# Altium schematic sheet CPU_PWR - +VCCCORE_1_3.schdoc
size 420 x 298 mm; Symbol: Sheet-Symbol_A3; Company: 嘉立创EDA; Version: V1.0; Page Size: A3; @Project Name: H610(2024/12/09); @Page Count: 36; @Update Date: 2026-10-20; @Create Date: 2026-10-20; @Schematic Name: SCHEMATIC1; @Page No: 27; @Page Name: CPU_PWR - +VCCCORE_1/3; Device: Sheet-Symbol_A3; @Board Name: SCHEMATIC1; @Create Time: 10:15:42; @Update Time: 10:18:20
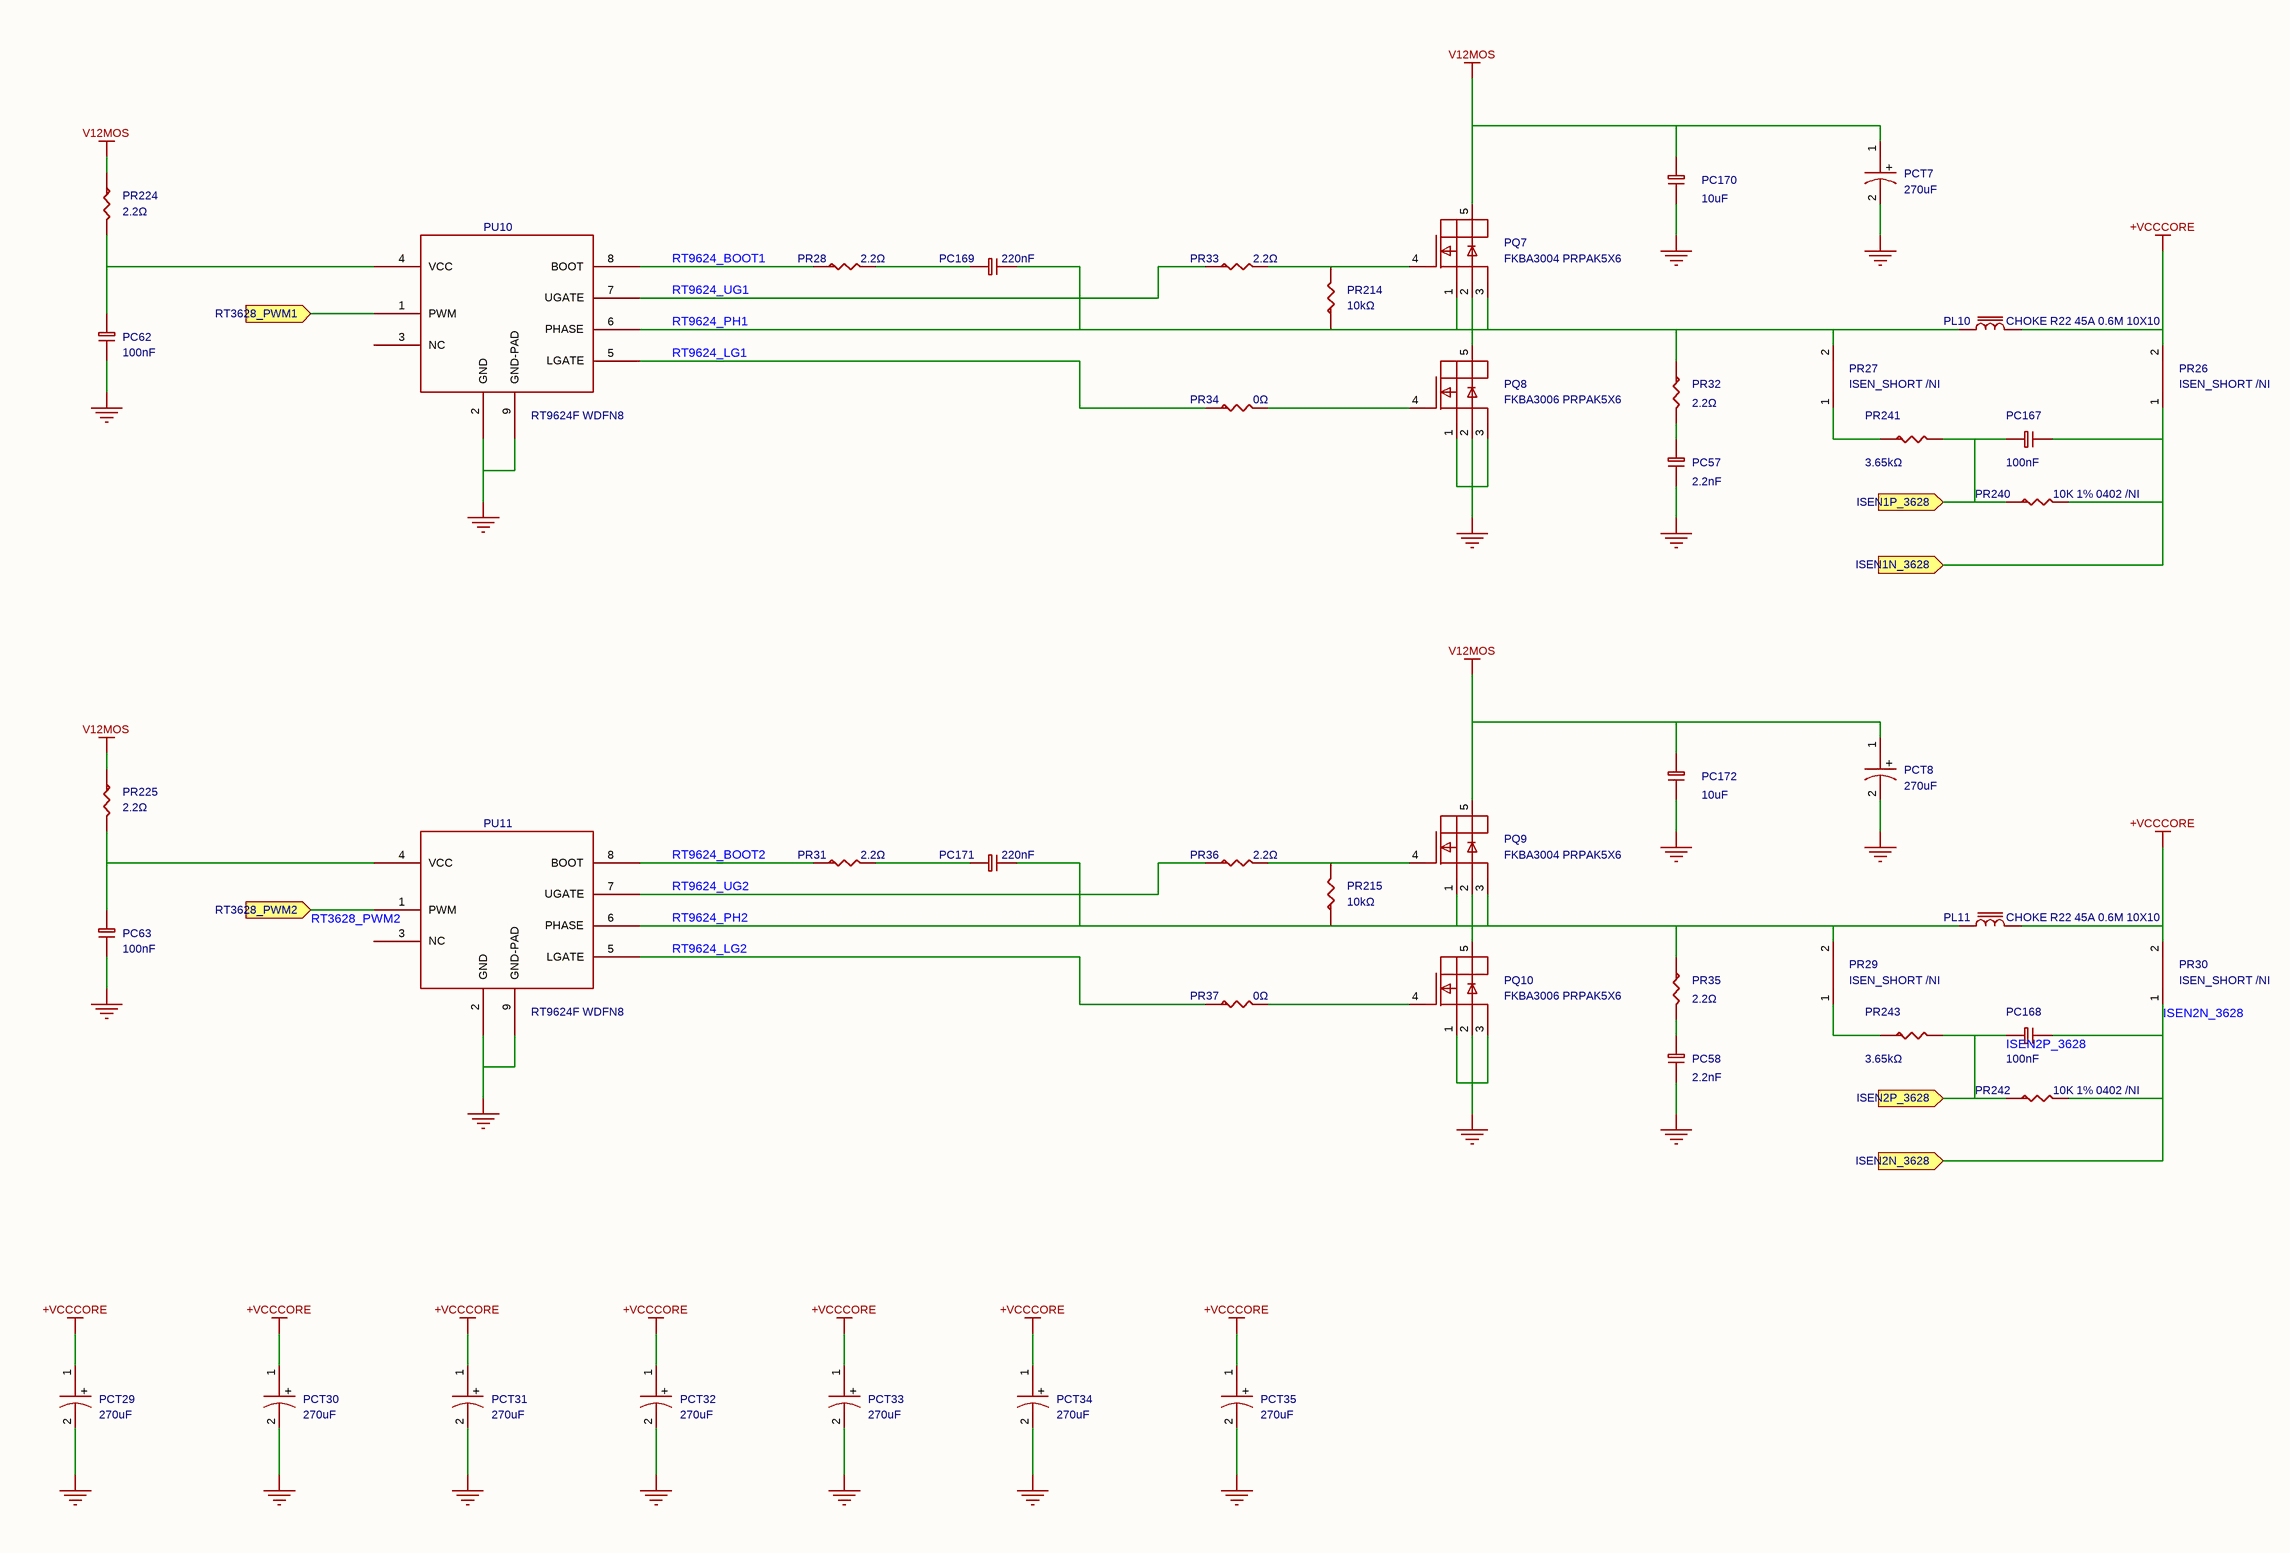
[diagram p0: CPU_PWR - +VCCCORE_1_3.schdoc]

## Parts
PC57  2.2nF  [C0402_2]
PC58  2.2nF  [C0402_2]
PC62  100nF  [C0402]
PC63  100nF  [C0402]
PC167  100nF  [C0402_3]
PC168  100nF  [C0402_3]
PC169  220nF  [C0402_3]
PC170  10uF  [C0805]
PC171  220nF  [C0402_3]
PC172  10uF  [C0805]
PCT7  270uF  [EC1P25C_2]
PCT8  270uF  [EC1P25C_2]
PCT29  270uF  [EC1P25C_2]
PCT30  270uF  [EC1P25C_2]
PCT31  270uF  [EC1P25C_2]
PCT32  270uF  [EC1P25C_2]
PCT33  270uF  [EC1P25C_2]
PCT34  270uF  [EC1P25C_2]
PCT35  270uF  [EC1P25C_2]
PL10  value CHOKE R22 45A 0.6M 10X10  [MAGIC R22]  (hidden comment: L_L70-P50-H70)
PL11  value CHOKE R22 45A 0.6M 10X10  [MAGIC R22]  (hidden comment: L_L70-P50-H70)
PQ7  value FKBA3004 PRPAK5X6  [PRPAK5X6_1]  (hidden comment: PK616BA)
PQ8  value FKBA3006 PRPAK5X6  [PRPAK5X6]  (hidden comment: PK616BA)
PQ9  value FKBA3004 PRPAK5X6  [PRPAK5X6_1]  (hidden comment: PK616BA)
PQ10  value FKBA3006 PRPAK5X6  [PRPAK5X6]  (hidden comment: PK616BA)
PR26  value ISEN_SHORT /NI  [ISEN_SHORTNI]  (hidden comment: R_0)
PR27  value ISEN_SHORT /NI  [ISEN_SHORTNI]  (hidden comment: R_0)
PR28  2.2Ω  [R0603_2]
PR29  value ISEN_SHORT /NI  [ISEN_SHORTNI]  (hidden comment: R_0)
PR30  value ISEN_SHORT /NI  [ISEN_SHORTNI]  (hidden comment: R_0)
PR31  2.2Ω  [R0603_2]
PR32  2.2Ω  [R0603_3]
PR33  2.2Ω  [R0603_3]
PR34  0Ω  [R0603_3]
PR35  2.2Ω  [R0603_3]
PR36  2.2Ω  [R0603_3]
PR37  0Ω  [R0603_3]
PR214  10kΩ  [R0402_1]
PR215  10kΩ  [R0402_1]
PR224  2.2Ω  [R0603]
PR225  2.2Ω  [R0603]
PR240  value 10K 1% 0402 /NI  [R0402_2]  (hidden comment: R-0603)
PR241  3.65kΩ  [R0402]
PR242  value 10K 1% 0402 /NI  [R0402_1]  (hidden comment: R-0603)
PR243  3.65kΩ  [R0402_3]
PU10  value RT9624F WDFN8  [DFN8_3X3MM-GND]  (hidden comment: RT9624FGQW)
PU11  value RT9624F WDFN8  [DFN8_3X3MM-GND]  (hidden comment: RT9624FGQW)

## Ports
ISEN1N_3628 (in), ISEN1P_3628 (in), ISEN2N_3628 (in), ISEN2P_3628 (in), RT3628_PWM1 (in), RT3628_PWM2 (in)

## Nets
+VCCCORE: PCT29.1 PCT30.1 PCT31.1 PCT32.1 PCT33.1 PCT34.1 PCT35.1 PL10.2 PL11.2 PR26.2 PR30.2
GND: PC57.2 PC58.2 PC62.2 PC63.2 PC170.1 PC172.1 PCT7.2 PCT8.2 PCT29.2 PCT30.2 PCT31.2 PCT32.2 PCT33.2 PCT34.2 PCT35.2 PQ8.1(SOURCE1) PQ8.2(SOURCE2) PQ8.3(SOURCE3) PQ10.1(SOURCE1) PQ10.2(SOURCE2) PQ10.3(SOURCE3) PU10.2(GND) PU10.9(GND-PAD) PU11.2(GND) PU11.9(GND-PAD)
V12MOS: PC170.2 PC172.2 PCT7.1 PCT8.1 PQ7.5(DRAIN1) PQ9.5(DRAIN1) PR224.1 PR225.1
ISEN1N_3628: PC167.2 PR26.1 PR240.2 ; port ISEN1N_3628
ISEN1P_3628: PC167.1 PR240.1 PR241.2 ; port ISEN1P_3628
ISEN2N_3628: PC168.2 PR30.1 PR242.2 ; port ISEN2N_3628
ISEN2P_3628: PC168.1 PR242.1 PR243.2 ; port ISEN2P_3628
RT3628_PWM1: PU10.1(PWM) ; port RT3628_PWM1
RT3628_PWM2: PU11.1(PWM) ; port RT3628_PWM2
RT9624_BOOT1: PR28.1 PU10.8(BOOT)
RT9624_BOOT2: PR31.1 PU11.8(BOOT)
RT9624_LG1: PR34.1 PU10.5(LGATE)
RT9624_LG2: PR37.1 PU11.5(LGATE)
RT9624_PH1: PC169.2 PL10.1 PQ7.1(SOURCE1) PQ7.2(SOURCE2) PQ7.3(SOURCE3) PQ8.5(DRAIN1) PR27.2 PR32.1 PR214.1 PU10.6(PHASE)
RT9624_PH2: PC171.2 PL11.1 PQ9.1(SOURCE1) PQ9.2(SOURCE2) PQ9.3(SOURCE3) PQ10.5(DRAIN1) PR29.2 PR35.1 PR215.1 PU11.6(PHASE)
RT9624_UG1: PR33.1 PU10.7(UGATE)
RT9624_UG2: PR36.1 PU11.7(UGATE)
NetPC57_1: PC57.1 PR32.2
NetPC58_1: PC58.1 PR35.2
NetPC62_1: PC62.1 PR224.2 PU10.4(VCC)
NetPC63_1: PC63.1 PR225.2 PU11.4(VCC)
NetPC169_1: PC169.1 PR28.2
NetPC171_1: PC171.1 PR31.2
NetPQ7_4: PQ7.4(GATE) PR33.2 PR214.2
NetPQ8_4: PQ8.4(GATE) PR34.2
NetPQ9_4: PQ9.4(GATE) PR36.2 PR215.2
NetPQ10_4: PQ10.4(GATE) PR37.2
NetPR27_1: PR27.1 PR241.1
NetPR29_1: PR29.1 PR243.1

Not connected (* = marked no-connect by the designer): PU10 3(NC); PU11 3(NC)

## Notes on the sheet
- 更新日期
- 2026-10-20
- 原理图
- 图页
- SCHEMATIC1
- CPU_PWR - +VCCCORE_1/3
- 创建日期
- 物料编码
- 审阅
- 绘制
- H610(2024/12/09)
- 版本
- V1.0
- 尺寸
- A3
- 页
- 27
- 嘉立创EDA
- 共
- 36
- (in symbol 160AREC271M0609) +

## Library data of the parts
PC57 PC58 = CC0402KRX7R9BB222: 容值:2.2nF;精度:±10%;额定电压:50V;材质(温度系数):X7R;; Manufacturer: YAGEO(国巨); Symbol: CAP; PCB Footprint: C0402; Tolerance: ±10%; ModelId: 36a51122f27c49738f86b3bfa98863e0; AddInBom: yes; Voltage Rated: 50V; ModelName: C0402_L1.0-W0.5-H0.5; ModelTransform: 39.37,19.685,0,0,0,0,0,0,0; Temperature Coefficient: X7R; Device: CC0402KRX7R9BB222; Value: 2.2nF; Supplier: LCSC; Datasheet: https://atta.szlcsc.com/upload/public/pdf/source/20170505/1493957848374.pdf; FootprintName: C0402_2; SupplierPart: C106861; ConvertToPcb: yes; LCSC Part Name: 2.2nF ±10% 50V; JLCPCB Part Class: Extended Part; ManufacturerPart: CC0402KRX7R9BB222; Supplier Footprint: 0402
PC62 PC63 = CL05B104KO5NNNC: 容值:100nF;精度:±10%;额定电压:16V;材质(温度系数):X7R;; Manufacturer: SAMSUNG(三星); Symbol: CAP; Tolerance: ±10%; ModelId: 36a51122f27c49738f86b3bfa98863e0; AddInBom: yes; Voltage Rated: 16V; ModelName: C0402_L1.0-W0.5-H0.5; ModelTransform: 39.37,19.685,0,0,0,0,0,0,0; Temperature Coefficient: X7R; Device: CL05B104KO5NNNC; PCB Footprint: C0402; Value: 100nF; Supplier: LCSC; Datasheet: https://atta.szlcsc.com/upload/public/pdf/source/20160103/1457707674891.pdf; FootprintName: C0402; SupplierPart: C1525; ConvertToPcb: yes; LCSC Part Name: 100nF ±10% 16V; JLCPCB Part Class: Basic Part; ManufacturerPart: CL05B104KO5NNNC; Supplier Footprint: 0402
PC167 PC168 = CL05B104KO5NNNC: 容值:100nF;精度:±10%;额定电压:16V;材质(温度系数):X7R;; Manufacturer: SAMSUNG(三星); Symbol: CAP; PCB Footprint: C0402; Tolerance: ±10%; ModelId: 36a51122f27c49738f86b3bfa98863e0; AddInBom: yes; Voltage Rated: 16V; ModelName: C0402_L1.0-W0.5-H0.5; ModelTransform: 39.37,19.685,0,0,0,0,0,0,0; Temperature Coefficient: X7R; Device: CL05B104KO5NNNC; Value: 100nF; Supplier: LCSC; Datasheet: https://atta.szlcsc.com/upload/public/pdf/source/20160103/1457707674891.pdf; FootprintName: C0402_3; SupplierPart: C1525; ConvertToPcb: yes; LCSC Part Name: 100nF ±10% 16V; JLCPCB Part Class: Basic Part; ManufacturerPart: CL05B104KO5NNNC; Supplier Footprint: 0402
PC169 PC171 = CL05B224KO5NNNC: 容值:220nF;精度:±10%;额定电压:16V;材质(温度系数):X7R;; Manufacturer: SAMSUNG(三星); Symbol: CAP; PCB Footprint: C0402; Tolerance: ±10%; ModelId: 36a51122f27c49738f86b3bfa98863e0; AddInBom: yes; Voltage Rated: 16V; ModelName: C0402_L1.0-W0.5-H0.5; ModelTransform: 39.37,19.685,0,0,0,0,0,0,0; Temperature Coefficient: X7R; Device: CL05B224KO5NNNC; Value: 220nF; Supplier: LCSC; Datasheet: https://atta.szlcsc.com/upload/public/pdf/source/20160103/1457707689724.pdf; FootprintName: C0402_3; SupplierPart: C16772; ConvertToPcb: yes; LCSC Part Name: 220nF ±10% 16V; JLCPCB Part Class: Basic Part; ManufacturerPart: CL05B224KO5NNNC; Supplier Footprint: 0402
PC170 PC172 = CL21A106KOQNNNE: 容值:10uF;精度:±10%;额定电压:16V;材质(温度系数):X5R;; Manufacturer: SAMSUNG(三星); Symbol: CAP NP_31; ModelId: 1ba041120af144c991958decab20d241; Tolerance: ±10%; AddInBom: yes; Voltage Rated: 16V; ModelName: C0805_L2.0-W1.3-H1.3; ModelTransform: 78.74,51.181,0,0,0,0,0,0.0005,0; Temperature Coefficient: X5R; Device: CL21A106KOQNNNE; Value: 10uF; Supplier: LCSC; Datasheet: https://atta.szlcsc.com/upload/public/pdf/source/20160103/1457707694240.pdf; FootprintName: C0805; SupplierPart: C1713; ConvertToPcb: yes; LCSC Part Name: 10uF ±10% 16V; JLCPCB Part Class: Extended Part; ManufacturerPart: CL21A106KOQNNNE; Supplier Footprint: 0805
PCT7 PCT8 PCT29-PCT35 = 160AREC271M0609: 容值:270uF;精度:±20%;额定电压:16V;纹波电流:3.8A@100kHz;等效串联电阻:15mΩ@100kHz~300kHz;类型:-;; Manufacturer: APAQ(钰邦); Symbol: CAPACITOR POL_0; AddInBom: yes; ModelId: 0a4db4bf24b443b3be4905be97ff10c5; ModelName: CAP-TH_BD6.3-P2.50-D1.0-FD; ModelTransform: 248.4247,247.99777,0,0,0,0,0,0,-137.795; Tolerance: ±20%; Rated Voltage: 16V; φD: 6.3mm; L: 9mm; Lifetime @ Temp: 2000hrs@105℃; Device: 160AREC271M0609; Value: 270uF; LCSC Part Name: 270uF ±20% 16V; SupplierPart: C176312; ManufacturerPart: 160AREC271M0609; Supplier Footprint: 插件,D6.3xL9mm; JLCPCB Part Class: Extended Part; Datasheet: https://atta.szlcsc.com/upload/public/pdf/source/20180420/C176312_A6CC051F3F5535015096354530D22B11.pdf; Supplier: LCSC; ConvertToPcb: yes; FootprintName: EC1P25C_2; Ripple Current: 3.8A@100kHz; Equivalent Series Resistance(ESR): 15mΩ@100kHz~300kHz; Type: -; Lead Spacing: 2.5mm; Operating Temperature: -55℃~+105℃
PL10 = L_L70-P50-H70_1: R22 一体成型直插电感; Check: false; Add into BOM: yes; Device: L_L70-P50-H70_1; Symbol: L_L70-P50-H70; FootprintName: MAGIC R22; ConvertToPcb: yes
PL11 = L_L70-P50-H70_1: Check: false; AddInBom: yes; Device: L_L70-P50-H70_1; Symbol: L_L70-P50-H70; FootprintName: MAGIC R22; ConvertToPcb: yes
PQ7-PQ10 = PK616BA: 类型:1个N沟道;漏源电压(Vdss):30V;连续漏极电流(Id):50A;功率(Pd):31W;导通电阻(RDS(on)@Vgs,Id):9.5mΩ@4.5V,13A;阈值电压(Vgs(th)@Id):3V@250uA;; Manufacturer: NIKO-SEM(尼克森); Symbol: MOS-N_SO8_1; AddInBom: yes; ModelId: 178189b27e7544aca50c111426555358; ModelName: PDFN-8_L4.9-W5.8-H1.0-P1.27; ModelTransform: 200.787,240.157,0,0,0,0,-0.097,0,0; Drain Source Voltage (Vdss): 30V; Continuous Drain Current (Id): 50A; Power Dissipation (Pd): 31W; Device: PK616BA; LCSC Part Name: 1个N沟道 耐压:30V 电流:50A; SupplierPart: C133608; ManufacturerPart: PK616BA; Supplier Footprint: PDFN-8(5.8x4.9); JLCPCB Part Class: Extended Part; Datasheet: https://atta.szlcsc.com/upload/public/pdf/source/20170930/C133608_1506736454344997453.pdf; Supplier: LCSC; ConvertToPcb: yes; Type: 1个N沟道; Drain Source On Resistance (RDS(on)@Vgs,Id): 9.5mΩ@4.5V,13A; Gate Threshold Voltage (Vgs(th)@Id): 3V@250uA
  PQ7 PQ9: FootprintName: PRPAK5X6_1
  PQ8 PQ10: FootprintName: PRPAK5X6
PR26 PR27 PR29 PR30 = R_0: Check: false; AddInBom: yes; Device: R_0; Symbol: R_0; FootprintName: ISEN_SHORTNI; ConvertToPcb: yes
PR28 PR31-PR33 PR35 PR36 = 0603WAF220KT5E: 电阻类型:厚膜电阻;阻值:2.2Ω;精度:±1%;功率:100mW;; Manufacturer: UNI-ROYAL(厚声); Symbol: R_1; ModelId: fc143cca1e79419f9cd78b61e9279f08; Tolerance: ±1%; AddInBom: yes; Power(Watts): 100mW; ModelName: R0603; ModelTransform: 31.8897,63.7794,0,90,0,0,0,0,0; Overload Voltage (Max): 75V; Temperature Coefficient: ±400ppm/℃; Device: 0603WAF220KT5E; Value: 2.2Ω; Type: 厚膜电阻; Supplier: LCSC; Datasheet: https://atta.szlcsc.com/upload/public/pdf/source/20200306/C422600_1E6D84923E4A46A82E41ADD87F860B5C.pdf; SupplierPart: C22939; ConvertToPcb: yes; LCSC Part Name: 2.2Ω ±1% 100mW; JLCPCB Part Class: Basic Part; ManufacturerPart: 0603WAF220KT5E; Supplier Footprint: 0603; Operating Temperature Range: -55℃~+155℃
  PR28 PR31: FootprintName: R0603_2
  PR32 PR33 PR35 PR36: FootprintName: R0603_3
PR34 PR37 = 0603WAF0000T5E: 电阻类型:厚膜电阻;阻值:0Ω;精度:±1%;功率:100mW;; Manufacturer: UNI-ROYAL(厚声); Symbol: R_1; ModelId: fc143cca1e79419f9cd78b61e9279f08; Tolerance: ±1%; AddInBom: yes; Power(Watts): 100mW; ModelName: R0603; ModelTransform: 31.8897,63.7794,0,90,0,0,0,0,0; Overload Voltage (Max): 75V; Device: 0603WAF0000T5E; Value: 0Ω; Type: 厚膜电阻; Supplier: LCSC; Datasheet: https://atta.szlcsc.com/upload/public/pdf/source/20200306/C422600_1E6D84923E4A46A82E41ADD87F860B5C.pdf; FootprintName: R0603_3; SupplierPart: C21189; ConvertToPcb: yes; LCSC Part Name: 0Ω ±1% 100mW; JLCPCB Part Class: Basic Part; ManufacturerPart: 0603WAF0000T5E; Supplier Footprint: 0603; Operating Temperature Range: -55℃~+155℃
PR214 PR215 = 0402WGF1002TCE: 电阻类型:厚膜电阻;阻值:10kΩ;精度:±1%;功率:62.5mW;; Manufacturer: UNI-ROYAL(厚声); Symbol: R-0603; ModelId: 671aefced39d4c318694bba8bd8efd39; Tolerance: ±1%; AddInBom: yes; Power(Watts): 62.5mW; ModelName: R0402_L1.0-W0.5-H0.5; ModelTransform: 39.37,19.685,0,0,0,0,0,0.0005,0; Overload Voltage (Max): 50V; Temperature Coefficient: ±100ppm/℃; Device: 0402WGF1002TCE; Value: 10kΩ; Type: 厚膜电阻; Supplier: LCSC; Datasheet: https://atta.szlcsc.com/upload/public/pdf/source/20200306/C422600_1E6D84923E4A46A82E41ADD87F860B5C.pdf; FootprintName: R0402_1; SupplierPart: C25744; ConvertToPcb: yes; LCSC Part Name: 10kΩ ±1% 62.5mW; JLCPCB Part Class: Basic Part; ManufacturerPart: 0402WGF1002TCE; Supplier Footprint: 0402; Operating Temperature Range: -55℃~+155℃
PR224 PR225 = 0603WAF220KT5E: 电阻类型:厚膜电阻;阻值:2.2Ω;精度:±1%;功率:100mW;; Manufacturer: UNI-ROYAL(厚声); Symbol: R_1; ModelId: fc143cca1e79419f9cd78b61e9279f08; Tolerance: ±1%; AddInBom: yes; Power(Watts): 100mW; ModelTransform: 31.8897,63.7794,0,90,0,0,0,0,0; Overload Voltage (Max): 75V; Temperature Coefficient: ±400ppm/℃; Device: 0603WAF220KT5E; Value: 2.2Ω; Type: 厚膜电阻; Supplier: LCSC; Datasheet: https://atta.szlcsc.com/upload/public/pdf/source/20200306/C422600_1E6D84923E4A46A82E41ADD87F860B5C.pdf; FootprintName: R0603; SupplierPart: C22939; ModelName: R0603; ConvertToPcb: yes; LCSC Part Name: 2.2Ω ±1% 100mW; JLCPCB Part Class: Basic Part; ManufacturerPart: 0603WAF220KT5E; Supplier Footprint: 0603; Operating Temperature Range: -55℃~+155℃
PR240 = R-0603_2: Manufacturer: YAGEO(国巨); Manufacturer Part: RC0402FR-0710KL; 3D Model: 671aefced39d4c318694bba8bd8efd39; 3D Model Transform: 39.37,19.685,0,0,0,0,0,0.0005,0; Tolerance: ±1%; Power(Watts): 62.5mW; Overload Voltage (Max): 50V; Temperature Coefficient: ±100ppm/℃; AddInBom: yes; Device: R-0603_2; Symbol: R-0603; LCSC Part Name: 厚膜电阻 10kΩ ±1% 62.5mW; Supplier Part: C60490; Supplier Footprint: 0402; JLCPCB Part Class: Extended Part; Datasheet: https://atta.szlcsc.com/upload/public/pdf/source/20170925/C131467_1506321478108990263.pdf; Supplier: LCSC; Type: 厚膜电阻; Operating Temperature Range: -55℃~+155℃; FootprintName: R0402_2; ConvertToPcb: yes
PR241 PR243 = ERJ2RKF3651X: 电阻类型:厚膜电阻;阻值:3.65kΩ;精度:±1%;功率:100mW;最大工作电压:100V;温度系数:±100ppm/℃;; Manufacturer: PANASONIC(松下); Symbol: R-0603; AddInBom: yes; ModelId: 671aefced39d4c318694bba8bd8efd39; ModelName: R0402_L1.0-W0.5-H0.5; ModelTransform: 39.37,19.685,0,0,0,0,0,0.0005,0; Tolerance: ±1%; Power(Watts): 100mW; Overload Voltage (Max): 100V; Device: ERJ2RKF3651X; Value: 3.65kΩ; LCSC Part Name: 3.65kΩ ±1% 100mW 厚膜电阻; SupplierPart: C416527; ManufacturerPart: ERJ2RKF3651X; Supplier Footprint: 0402; JLCPCB Part Class: Extended Part; Datasheet: https://atta.szlcsc.com/upload/public/pdf/source/20190902/C416527_C4564A8D72F3E2A9CDC3D7769B95121D.pdf; Supplier: LCSC; ConvertToPcb: yes; Type: 厚膜电阻; Temperature Coefficient: ±100ppm/℃; Operating Temperature Range: -55℃~+155℃
  PR241: FootprintName: R0402
  PR243: FootprintName: R0402_3
PR242 = R-0603_3: Manufacturer: YAGEO(国巨); Manufacturer Part: RC0402FR-0710KL; 3D Model: 671aefced39d4c318694bba8bd8efd39; 3D Model Transform: 39.37,19.685,0,0,0,0,0,0.0005,0; Tolerance: ±1%; Power(Watts): 62.5mW; Overload Voltage (Max): 50V; Temperature Coefficient: ±100ppm/℃; AddInBom: yes; Device: R-0603_3; Symbol: R-0603; LCSC Part Name: 厚膜电阻 10kΩ ±1% 62.5mW; Supplier Part: C60490; Supplier Footprint: 0402; JLCPCB Part Class: Extended Part; Datasheet: https://atta.szlcsc.com/upload/public/pdf/source/20170925/C131467_1506321478108990263.pdf; Supplier: LCSC; Type: 厚膜电阻; Operating Temperature Range: -55℃~+155℃; FootprintName: R0402_1; ConvertToPcb: yes
PU10 PU11 = RT9624FGQW: Manufacturer: RICHTEK(立锜); Symbol: RT9624F_1; AddInBom: yes; ModelId: 87cbd0851a6d45bba9a717edfc43b2c9; ModelName: TDFN-8_L3.0-W3.0-P0.65-BL-EP2.3; ModelTransform: 118.11,118.8974,0,0,0,0,0,0,0; Device: RT9624FGQW; LCSC Part Name: Single Phase Synchronous Rectified Buck MOSFET Driver; SupplierPart: C3020454; ManufacturerPart: RT9624FGQW; Supplier Footprint: TDFN-8-EP(3x3); JLCPCB Part Class: Extended Part; Datasheet: https://atta.szlcsc.com/upload/public/pdf/source/20220608/64F557171D909C63F38446B0F2BC2FB2.pdf; Supplier: LCSC; ConvertToPcb: yes; FootprintName: DFN8_3X3MM-GND